# Altium schematic sheet 400_BUCK_3V3.SchDoc: CONVERTIDOR BUCK 3V3V
size A4; Date: 23/10/2026; DrawnBy: Santiago Londoño; SheetNumber: 4; SheetTotal: 8
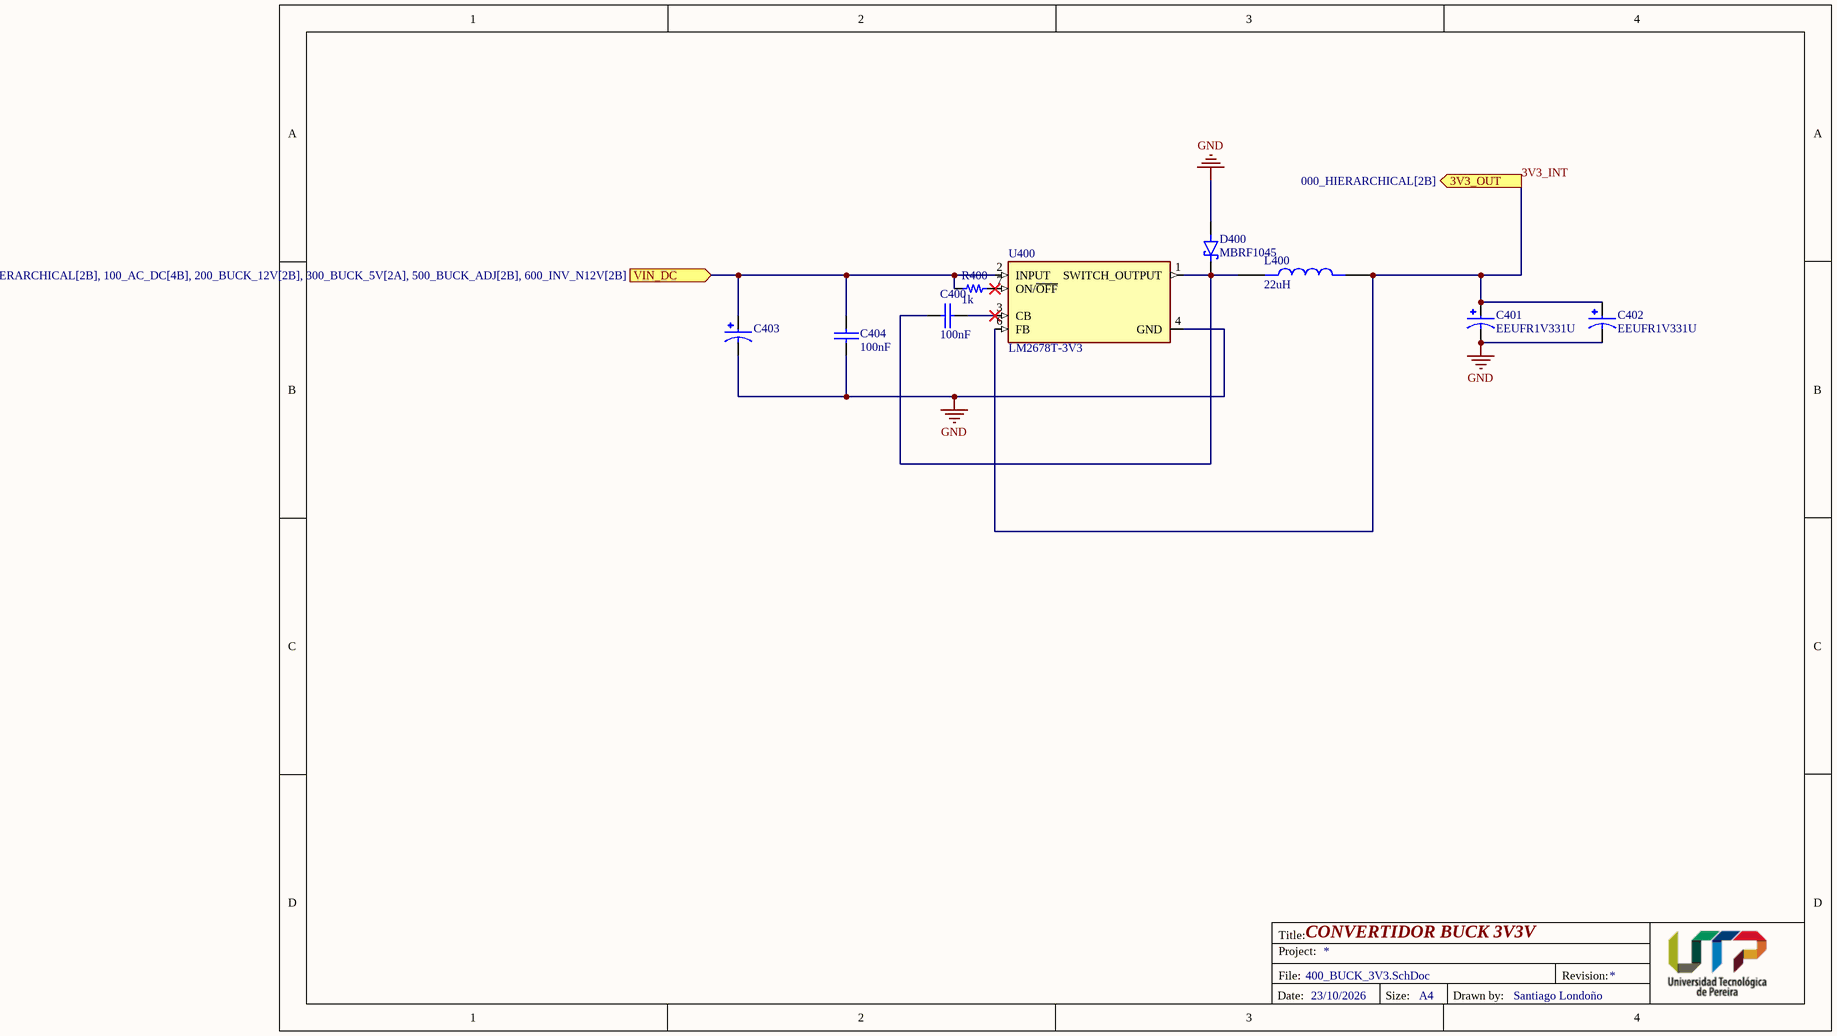
[diagram p0: 400_BUCK_3V3.SchDoc]

## Parts
C400  value 100nF  [1206]  (hidden comment: 100nF 100V)
C401  EEUFR1V331U  [CAPPRD500W60D1000H1250]
C402  EEUFR1V331U  [CAPPRD500W60D1000H1250]
C403  EEUFR1H561B  [CAPPRD500W60D1250H2500]  (value not drawn)
C404  value 100nF  [1206]  (hidden comment: 100nF 100V)
D400  MBRF1045  [TO508P995X450X1960-2]
L400  22uH  [IND_SER2918H-333KL]
R400  value 1k  [0201]  (hidden comment: 1k 1/20W)
U400  LM2678T-3V3  [TO127P1041X469X2199-7N]

## Ports
3V3_OUT (out, see 000_HIERARCHICAL[2B]), VIN_DC (in, see 000_HIERARCHICAL[2B], 100_AC_DC[4B], 200_BUCK_12V[2B], 300_BUCK_5V[2A], 500_BUCK_ADJ[2B], 600_INV_N12V[2B])

## Nets
GND: C401.N C402.N C403.N C404.2 D400.2(A) U400.4(GND)
3V3_INT: C401.P C402.P L400.2 U400.6(FB) ; port 3V3_OUT
VIN_DC: C403.P C404.1 R400.2 U400.2(INPUT) ; port VIN_DC
NetC400_1: C400.1 D400.1(K) L400.1 U400.1(SWITCH_OUTPUT)
NetC400_2: C400.2 U400.3(CB)
NetR400_1: R400.1 U400.7(ON/~{OFF})

## Notes on the sheet
- Title:
- Project:
- File:
- Revision:
- Date:
- Size:
- A4
- Drawn by:

## Library data of the parts
C400 C404 = Cap_0.1uF_1206_100V: CAP CER 0.1UF 100V X7R 1206; Manufacturer: Samsung Electro-Mechanics; Manufacturer Part Number: CL31B104KCFNNNE; Supplier 1: Digi-Key; Supplier Part Number 1: 1276-1151-1-ND; Last modified by: J.Jaramillo; Last modified date: 20240309; ComponentLink1Description: Digi-Key; ComponentLink1URL: https://www.digikey.com/en/products/detail/samsung-electro-mechanics/CL31B104KCFNNNE/3886809
C401 C402 = EEUFR1V331U: CAP ALUM 330UF 20% 35V RADIAL TH; MF: Panasonic; Check_prices: https://www.snapeda.com/parts/EEUFR1V331U/Panasonic/view-part/?ref=eda; Value: *; Purchase-URL: https://pricing.snapeda.com/search/part/EEUFR1V331U/?ref=eda; Price: None; MP: EEUFR1V331U; SnapEDA_Link: https://www.snapeda.com/parts/EEUFR1V331U/Panasonic/view-part/?ref=snap; Availability: In Stock; Package: RADIAL-2 Panasonic
C403 = EEUFR1H561B: MF: {'manufacturer': u'Panasonic Electronic Components'}; Package: None; Price: None; Value: *; MP: EEUFR1H561B; Availability: Unavailable
L400 = SER2918H-333KL: INDUCTOR, PWR, 33UH, 28A, 0.1, 10MHZ; Product Range:COILCRAFT - SER2900 Series; Inductance:33ÂµH; Inductance Tolerance:Â± 10%; Inductor Construction:Shielded; DC Resistance Max:2860Âµohm; RMS Current (Irms):28A; Saturation Current (Isat):7A; Case Dimensio; SnapEDA_Link: https://www.snapeda.com/parts/SER2918H-333KL/Coilcraft/view-part/?ref=snap; Package: None; Value: *; MF: Coilcraft; MP: SER2918H-333KL; Check_prices: https://www.snapeda.com/parts/SER2918H-333KL/Coilcraft/view-part/?ref=eda
R400 = Res_1k_0201_1/20W: RES 1K OHM 1% 1/20W 0201; Manufacturer: YAGEO; Manufacturer Part Number: RC0201FR-071KL; Supplier 1: Digi-Key; Supplier Part Number 1: 311-1KMCT-ND; Reel Stock: N/A; Last modified by: J.Jaramillo; Last modified date: 20240310; ComponentLink1Description: Digi-Key; ComponentLink1URL: https://www.digikey.com/en/products/detail/yageo/RC0201FR-071KL/3202389?s=N4IgTCBcDaIMwEYEFoEGkCyBhAKsgcgCIgC6AvkA
U400 = LM2678T-ADJ: 8V to 40V, 5A SIMPLE SWITCHER buck converter with high efficiency 7-TO-220 -40 to 125; MF: Texas Instruments; SnapEDA_Link: https://www.snapeda.com/parts/LM2678T-ADJ/Texas+Instruments/view-part/?ref=snap; Package: TO-220-7 Texas Instruments; Value: *; MP: LM2678T-ADJ; Check_prices: https://www.snapeda.com/parts/LM2678T-ADJ/Texas+Instruments/view-part/?ref=eda
D400 = MBRF1045: Availability: Unavailable; Value: *; Package: None; MP: MBRF1045; Price: None